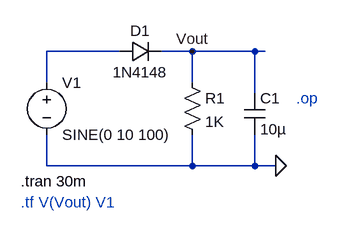
[diagram p0: schematic Project_2_Rectifier.asc]
Project_2_Rectifier.asc, the LTspice schematic file:
Version 4.1
SHEET 1 880 680
WIRE 160 64 48 64
WIRE 272 64 224 64
WIRE 368 64 272 64
WIRE 384 64 368 64
WIRE 48 112 48 64
WIRE 272 112 272 64
WIRE 368 128 368 64
WIRE 48 240 48 192
WIRE 272 240 272 192
WIRE 272 240 48 240
WIRE 368 240 368 192
WIRE 368 240 272 240
WIRE 400 240 368 240
FLAG 400 240 0
FLAG 272 64 Vout
SYMBOL voltage 48 96 R0
WINDOW 123 0 0 Left 0
WINDOW 39 0 0 Left 0
SYMATTR InstName V1
SYMATTR Value SINE(0 10 100)
SYMBOL res 256 96 R0
SYMATTR InstName R1
SYMATTR Value 1K
SYMBOL diode 160 80 R270
WINDOW 0 32 32 VTop 2
WINDOW 3 0 32 VBottom 2
SYMATTR InstName D1
SYMATTR Value 1N4148
SYMBOL cap 352 128 R0
SYMATTR InstName C1
SYMATTR Value 10µ
TEXT 8 264 Left 2 !.tran 30m
TEXT 8 296 Left 2 ;.tf V(Vout) V1
TEXT 432 136 Left 2 ;.op

The netlist it stands for:
* Project_2_Rectifier.asc
V1 N001 0 SINE(0 10 100)
R1 Vout 0 1K
D1 N001 Vout 1N4148
C1 Vout 0 10µ
.model D D
.lib standard.dio
.tran 30m
* .tf V(Vout) V1
* .op
.backanno
.end